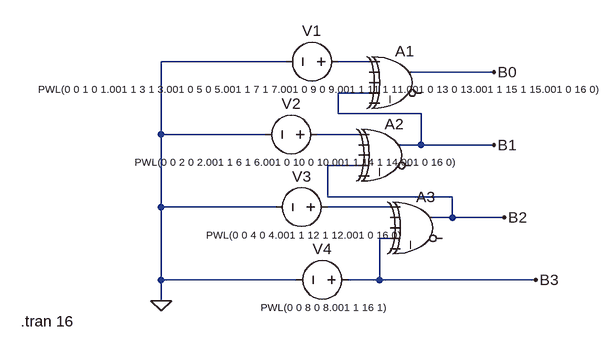
[diagram p0: schematic graytobinary.asc]
graytobinary.asc, the LTspice schematic file:
Version 4.1
SHEET 1 880 680
WIRE 32 64 -160 64
WIRE 160 64 112 64
WIRE 352 80 224 80
WIRE 160 112 112 112
WIRE 112 144 112 112
WIRE 240 144 112 144
WIRE -160 176 -160 64
WIRE 0 176 -160 176
WIRE 144 176 80 176
WIRE 240 192 240 144
WIRE 240 192 208 192
WIRE 352 192 240 192
WIRE 144 224 96 224
WIRE 96 272 96 224
WIRE 288 272 96 272
WIRE -160 288 -160 176
WIRE 16 288 -160 288
WIRE 192 288 96 288
WIRE 288 304 288 272
WIRE 288 304 256 304
WIRE 368 304 288 304
WIRE 192 336 176 336
WIRE -160 400 -160 288
WIRE 48 400 -160 400
WIRE 176 400 176 336
WIRE 176 400 128 400
WIRE 416 400 176 400
WIRE -160 432 -160 400
FLAG -160 432 0
FLAG 352 80 B0
FLAG 352 192 B1
FLAG 368 304 B2
FLAG 416 400 B3
SYMBOL Digital\\xor 208 32 R0
SYMATTR InstName A1
SYMBOL Digital\\xor 192 144 R0
SYMATTR InstName A2
SYMBOL voltage 128 64 R90
WINDOW 0 -32 56 VBottom 2
WINDOW 3 32 56 VTop 1
WINDOW 123 0 0 Left 0
WINDOW 39 0 0 Left 0
SYMATTR InstName V1
SYMATTR Value PWL(0 0 1 0 1.001 1 3 1 3.001 0 5 0 5.001 1 7 1 7.001 0 9 0 9.001 1 11 1 11.001 0 13 0 13.001 1 15 1 15.001 0 16 0)
SYMBOL voltage 96 176 R90
WINDOW 0 -32 56 VBottom 2
WINDOW 3 32 56 VTop 1
WINDOW 123 0 0 Left 0
WINDOW 39 0 0 Left 0
SYMATTR InstName V2
SYMATTR Value PWL(0 0 2 0 2.001 1 6 1 6.001 0 10 0 10.001 1 14 1 14.001 0 16 0)
SYMBOL voltage 112 288 R90
WINDOW 0 -32 56 VBottom 2
WINDOW 3 32 56 VTop 1
WINDOW 123 0 0 Left 0
WINDOW 39 0 0 Left 0
SYMATTR InstName V3
SYMATTR Value PWL(0 0 4 0 4.001 1 12 1 12.001 0 16 0)
SYMBOL voltage 144 400 R90
WINDOW 0 -32 56 VBottom 2
WINDOW 3 32 56 VTop 1
WINDOW 123 0 0 Left 0
WINDOW 39 0 0 Left 0
SYMATTR InstName V4
SYMATTR Value PWL(0 0 8 0 8.001 1 16 1)
SYMBOL Digital\\xor 240 256 R0
SYMATTR InstName A3
TEXT -376 464 Left 2 !.tran 16

The netlist it stands for:
* graytobinary.asc
A1 N001 0 0 B1 0 0 B0 0 XOR
A2 N002 0 0 B2 0 0 B1 0 XOR
V1 N001 0 PWL(0 0 1 0 1.001 1 3 1 3.001 0 5 0 5.001 1 7 1 7.001 0 9 0 9.001 1 11 1 11.001 0 13 0 13.001 1 15 1 15.001 0 16 0)
V2 N002 0 PWL(0 0 2 0 2.001 1 6 1 6.001 0 10 0 10.001 1 14 1 14.001 0 16 0)
V3 N003 0 PWL(0 0 4 0 4.001 1 12 1 12.001 0 16 0)
V4 B3 0 PWL(0 0 8 0 8.001 1 16 1)
A3 N003 0 0 B3 0 0 B2 0 XOR
.tran 16
.backanno
.end